# Altium project AHPR_Power_Management_and_Controls_Board.PrjPcb (part 1 of 2)
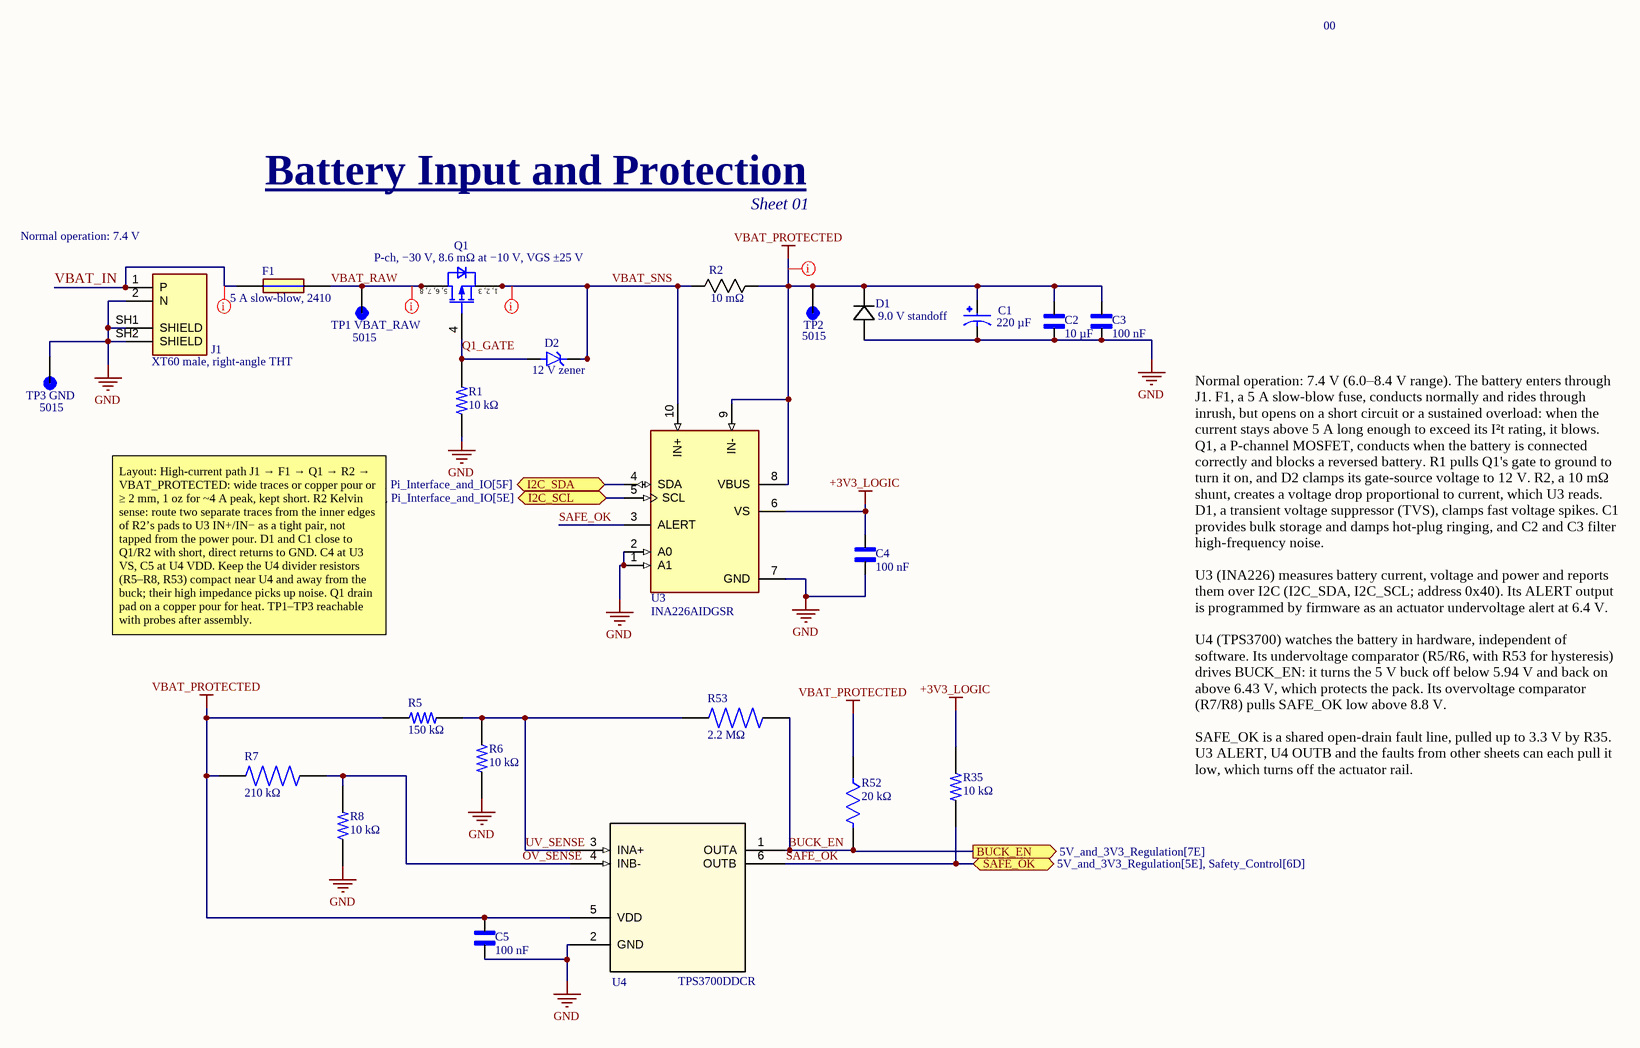
[diagram p0: Battery_Input_and_Protection.SchDoc]
5 sheets, 89 parts. Net scope: flat (ports and power ports of the same name join across sheets).
Board file: AHPR_Power_Management_and_Controls_Board.PcbDoc
Sheets:
  Battery_Input_and_Protection.SchDoc
  5V_and_3V3_Regulation.SchDoc
  Actuator_Power_and_Dynamixel_Bus.SchDoc
  Safety_Control.SchDoc
  Pi_Interface_and_IO.SchDoc

## Sheet Battery_Input_and_Protection.SchDoc
size 431 x 279 mm; SheetNumber: 1; SheetTotal: 5

### Parts
C1  220 µF  [CAP_EEEFK1E221GV]
C2  10 µF  [CAPC3216X180N]
C3  100 nF  [CAPC1608X90N]
C4  100 nF  [CAPC1608X90N]
C5  100 nF  [CAPC1608X90N]
D1  9.0 V standoff  [SMBJSeries_LTF]
D2  12 V zener  [DIO_BZT52C12-7-F]
F1  5 A slow-blow, 2410  [FUSC6127X294N]
J1  XT60 male, right-angle THT  [AMASS_XT60PW-M]
Q1  P-ch, −30 V, 8.6 mΩ at −10 V, VGS ±25 V  [INF-PG-TSDSON-8-2-V]
R1  10 kΩ  [RESC1607X60N]
R2  10 mΩ  [RES_2512_WSL]
R5  150 kΩ  [RESC1607X60N]
R6  10 kΩ  [RESC1607X60N]
R7  210 kΩ  [RESC1608X55N]
R8  10 kΩ  [RESC1607X60N]
R35  10 kΩ  [RESC1607X60N]
R52  20 kΩ  [FP-RC0603-0_55-IPC_C]
R53  2.2 MΩ  [RESC1608X55N]
TP1_VBAT_RAW  5015  [KEYSTONE_5015]
TP2  5015  [KEYSTONE_5015]
TP3_GND  5015  [KEYSTONE_5015]
U3  INA226AIDGSR  [SOP50P490X110-10N]
U4  TPS3700DDCR  [DDC6_TEX]

### Ports
BUCK_EN (out, see 5V_and_3V3_Regulation[7E]), I2C_SCL (bidir, see Pi_Interface_and_IO[5C], Pi_Interface_and_IO[5E]), I2C_SDA (bidir, see Pi_Interface_and_IO[5C], Pi_Interface_and_IO[5F]), SAFE_OK (bidir, see 5V_and_3V3_Regulation[5E], Safety_Control[6D])

### Nets
+3V3_LOGIC: C4.1 R35.1 U3.6(VS)
GND: C1.2 C2.2 C3.2 C4.2 C5.2 D1.2 J1.2(N) J1.SH1(SHIELD) J1.SH2(SHIELD) R1.1 R6.2 R8.1 TP3_GND.TP U3.1(A1) U3.2(A0) U3.7(GND) U4.2(GND)
VBAT_PROTECTED: C1.1 C2.1 C3.1 C5.1 D1.1 R2.2 R5.1 R7.2 R52.1 TP2.TP U3.8(VBUS) U3.9(IN-) U4.5(VDD)
BUCK_EN: R52.2 R53.1 U4.1(OUTA) ; port BUCK_EN
I2C_SCL: U3.5(SCL) ; port I2C_SCL
I2C_SDA: U3.4(SDA) ; port I2C_SDA
OV_SENSE: R7.1 R8.2 U4.4(INB-)
Q1_GATE: D2.2(A) Q1.4(Gate) R1.2
SAFE_OK: R35.2 U3.3(ALERT) U4.6(OUTB) ; port SAFE_OK
UV_SENSE: R5.2 R6.1 R53.2 U4.3(INA+)
VBAT_IN: F1.1 J1.1(P)
VBAT_RAW: F1.2 Q1.5(DRAIN) Q1.6(DRAIN) Q1.7(DRAIN) Q1.8(DRAIN) TP1_VBAT_RAW.TP
VBAT_SNS: D2.1(K) Q1.1(SOURCE) Q1.2(SOURCE) Q1.3(SOURCE) R2.1 U3.10(IN+)

### Layout directives
net class POWER_HI: VBAT_IN, VBAT_PROTECTED, VBAT_RAW, VBAT_SNS

### Notes on the sheet
- 00
- Battery Input and Protection
- (near J1) Normal operation: 7.4 V
- Sheet 01
- Layout: High-current path J1 → F1 → Q1 → R2 → VBAT_PROTECTED: wide traces or copper pour or ≥ 2 mm, 1 oz for ~4 A peak, kept short. R2 Kelvin sense: route two separate traces from the inner edges of R2’s pads to U3 IN+/IN− as a tight pair, not tapped from the power pour. D1 and C1 close to Q1/R2 with short, direct returns to GND. C4 at U3 VS, C5 at U4 VDD. Keep the U4 divider resistors (R5–R8, R53) compact near U4 and away from the buck; their high impedance picks up noise. Q1 drain pad on a copper pour for heat. TP1–TP3 reachable with probes after assembly.
- Normal operation: 7.4 V (6.0–8.4 V range). The battery enters through J1. F1, a 5 A slow-blow fuse, conducts normally and rides through inrush, but opens on a short circuit or a sustained overload: when the current stays above 5 A long enough to exceed its I²t rating, it blows. Q1, a P-channel MOSFET, conducts when the battery is connected correctly and blocks a reversed battery. R1 pulls Q1's gate to ground to turn it on, and D2 clamps its gate-source voltage to 12 V. R2, a 10 mΩ shunt, creates a voltage drop proportional to current, which U3 reads. D1, a transient voltage suppressor (TVS), clamps fast voltage spikes. C1 provides bulk storage and damps hot-plug ringing, and C2 and C3 filter high-frequency noise.
  U3 (INA226) measures battery current, voltage and power and reports them over I2C (I2C_SDA, I2C_SCL; address 0x40). Its ALERT output is programmed by firmware as an actuator undervoltage alert at 6.4 V.
  U4 (TPS3700) watches the battery in hardware, independent of software. Its undervoltage comparator (R5/R6, with R53 for hysteresis) drives BUCK_EN: it turns the 5 V buck off below 5.94 V and back on above 6.43 V, which protects the pack. Its overvoltage comparator (R7/R8) pulls SAFE_OK low above 8.8 V.
  SAFE_OK is a shared open-drain fault line, pulled up to 3.3 V by R35. U3 ALERT, U4 OUTB and the faults from other sheets can each pull it low, which turns off the actuator rail.
- DWG. NO.
- REV.
- SHT.
- THIS DOCUMENT AND THE DATA DISCLOSED HEREIN OR HEREWITH IS THE PROPERTY OF ALTIUM LIMITED AND MAY BE FREELY DISTRIBUTED IN WHOLE. NO RIGHTS ARE RESERVED OR EXPRESS OR IMPLIED WARANTEE GIVEN.
- REVISION
- DESCRIPTION
- DATE
- APPROVED
- ENG:
- APPROVALS
- PROJECT
- DSN:
- CHK:
- REFERENCE DOCUMENTS
- PROJECT REVISION:
- TITLE
- DOCUMENT REVISION:
- DESIGN ITEM:
- BOM:
- FAB DWG:
- PCB DWG:
- ASSY DWG:
- SCALE:
- SIZE
- B
- CAGE CODE
- FILE NAME
- DWG NO.
- SHEET
- OF
- REV
- (in symbol BSZ086P03NS3 G) 5, 6, 7, 8; 1, 2, 3

### Library data of the parts
C1 = EEEFK1E221GV: CAP ALUM 220UF 20% 25V SMD / EEEFK1E221GV / 220 µF 25 V, 160 mΩ ESR, SMD can / https://www.digikey.it/en/products/detail/panasonic-industry/EEE-FK1E221GV/10291405 / EEEFK1E221GV 220 µF 25 V, 160 mΩ ESR, SMD can; Value: *; Package: RADIAL-2 Panasonic; Purchase-URL: https://pricing.snapeda.com/search/part/EEEFK1E221GV/?ref=eda; MF: Panasonic; Check_prices: https://www.snapeda.com/parts/EEEFK1E221GV/Panasonic/view-part/?ref=eda; Price: None; MP: EEEFK1E221GV; Availability: In Stock; SnapEDA_Link: https://www.snapeda.com/parts/EEEFK1E221GV/Panasonic/view-part/?ref=snap
C2 = GRM31CR71E106KA12L: SMD capacitor X7R(EIA) with capacitance 10uF Tol.10%. Rated voltage 25Vdc 125C / 10 µF 25 V X7R 1206 / GRM31CR71E106KA12L / https://octopart.com/part/murata/GRM31CR71E106KA12L?slid=404c199c-e740-4f3a-ac3d-8ed7f0d5c56c&ssid=37a7cfac-85e6-4eb9-ad27-42d001a336a3#CadModels; MF: Murata Electronics; SnapEDA_Link: https://www.snapeda.com/parts/GRM31CR71E106KA12L/Murata+Electronics+North+America/view-part/?ref=snap; Package: 1206 Murata; Value: *; MP: GRM31CR71E106KA12L; Check_prices: https://www.snapeda.com/parts/GRM31CR71E106KA12L/Murata+Electronics+North+America/view-part/?ref=eda
C3 = GRM188R71H104KA93D: SMD Capacitor X7R(EIA) with Capacitance: 0.10uF Tol. 10%. Rated Voltage: 50Vdc / 100 nF 50 V X7R 0603 / GRM188R71H104KA93D / https://octopart.com/part/murata/GRM188R71H104KA93D?slid=b13dff97-c438-4242-af73-a6dd7cbdd469&ssid=f8334882-7657-41cd-b7d6-fdf9f837711d#CadModels; MF: Murata; SnapEDA_Link: https://www.snapeda.com/parts/GRM188R71H104KA93D/Murata/view-part/?ref=snap; Package: 1608 Murata; Value: *; MP: GRM188R71H104KA93D; Check_prices: https://www.snapeda.com/parts/GRM188R71H104KA93D/Murata/view-part/?ref=eda
C4 = GRM188R71E104KA01D: SMD Capacitor X7R(EIA) with Capacitance: 0.10uF Tol. 10%. Rated Voltage: 25Vdc / 100 nF 25 V X7R 0603 / https://octopart.com/search?full_query=GRM188R71E104KA01D&q=GRM188R71E104KA01D&s=1; MF: Murata Electronics; SnapEDA_Link: https://www.snapeda.com/parts/GRM188R71E104KA01D/Murata+Electronics+North+America/view-part/?ref=snap; Package: 1608 Murata; Value: *; MP: GRM188R71E104KA01D; Check_prices: https://www.snapeda.com/parts/GRM188R71E104KA01D/Murata+Electronics+North+America/view-part/?ref=eda
C5 = GRM188R71E104KA01D: SMD Capacitor X7R(EIA) with Capacitance: 0.10uF Tol. 10%. Rated Voltage: 25Vdc / https://octopart.com/search?full_query=GRM188R71E104KA01D&q=GRM188R71E104KA01D&s=1; MF: Murata Electronics; SnapEDA_Link: https://www.snapeda.com/parts/GRM188R71E104KA01D/Murata+Electronics+North+America/view-part/?ref=snap; Package: 1608 Murata; Value: *; MP: GRM188R71E104KA01D; Check_prices: https://www.snapeda.com/parts/GRM188R71E104KA01D/Murata+Electronics+North+America/view-part/?ref=eda
D1 = SMBJ9.0A: SMBJ9.0A / 9.0 V standoff, SMB / https://www.digikey.ie/en/products/detail/littelfuse-inc/SMBJ9-0A/688270; Manufacturer_Name: Littelfuse Inc; Copyright: Copyright (C) 2025 Ultra Librarian. All rights reserved.; Manufacturer_Part_Number: SMBJ9.0A
D2 = BZT52C12-7-F: Zener Diode 12V 5.3% 500mW SOD123 | Diodes Inc BZT52C12-7-F / BZT52C12-7-F 12 V zener, SOD-123 / https://www.digikey.com/en/products/detail/diodes-incorporated/BZT52C12-7-F/717727; MF: Diodes Inc.; SnapEDA_Link: https://www.snapeda.com/parts/BZT52C12-7-F/Diodes+Inc./view-part/?ref=snap; Package: SOD-123 Fairchild Semiconductor; Value: *; MP: BZT52C12-7-F; Check_prices: https://www.snapeda.com/parts/BZT52C12-7-F/Diodes+Inc./view-part/?ref=eda
F1 = 0454005.MR: Surface Mount Fuses 125VAC 5A .0136ohms 454 NANO2  Small size  Wide range of current rating available (0.375A to 12A)  Wide operating temperature range  RoHS compliant and Halogen Free  UL Recognized to UL/ CSA/NMX UL 248-1 and UL/CSA/NMX UL 248-14  Conforms to DENANs Appendix 3 / https://www.littelfuse.com/assetdocs/fuse-452-and-454-datasheet?assetguid=8C87AA93-80A7-4EA8-8749-A19BA03901C2; Geometry.Height: 2.94mm; Manufacturer_Name: LITTELFUSE; Manufacturer_Part_Number: 0454005.MR; Mouser Part Number: 576-0454005.MR; Mouser Price/Stock: https://www.mouser.co.uk/ProductDetail/Littelfuse/0454005MR?qs=WtG364jHAdzqVvZG3rAI%2Fw%3D%3D; Arrow Part Number: 0454005.MR; Arrow Price/Stock: https://www.arrow.com/en/products/0454005.mr/littelfuse?region=nac; Datasheet Link: https://www.mouser.com/datasheet/2/240/media-3321648.pdf
J1 = XT60PW-M: Socket, DC supply, male, PIN: 2 / https://octopart.com/part/amass/XT60PW-M; MF: AMASS; SnapEDA_Link: https://www.snapeda.com/parts/XT60PW-M/AMASS/view-part/?ref=snap; Package: Package; Value: *; MP: XT60PW-M; Check_prices: https://www.snapeda.com/parts/XT60PW-M/AMASS/view-part/?ref=eda
Q1 = BSZ086P03NS3 G: Insulated-Gate Field-Effect Transistor (IGFET), P-Channel, Enhancement, Body Diode, Pin 1 Source, 2 Source, 3 Source, 4 Gate, 5 Drain, 6 Drain, 7 Drain, 8 Drain, 8 Pins / BSZ086P03NS3 G / https://www.digikey.com/en/products/detail/infineon-technologies/BSZ086P03NS3GATMA1/2080736; Manufacturer: Infineon Technologies; Manufacturer Order Number: BSZ086P03NS3 G; PackageReference: PG-DSO-8-902
R1 R8 = RC0603FR-0710KL: 10 kOhms Â±1% 0.1W, 1/10W Chip Resistor 0603 (1608 Metric) Moisture Resistant Thick Film / 10 kΩ 1 % 0603 / https://octopart.com/part/yageo-group/RC0603FR-0710KL?slid=54dab893-c3ad-4fe4-85ee-8bc12f36e62a&ssid=b3dacb3c-e3ba-451e-bc50-2e154119b6bd#CadModels; MF: Yageo; SnapEDA_Link: https://www.snapeda.com/parts/RC0603FR-0710KL/Yageo/view-part/?ref=snap; Package: 0603 Yageo; Value: *; MP: RC0603FR-0710KL; Check_prices: https://www.snapeda.com/parts/RC0603FR-0710KL/Yageo/view-part/?ref=eda
R2 = WSL2512R0100FEA: WSL-2512 .01 1% EA e3 / WSL2512R0100FEA 10 mΩ 1 % 1 W, 2512 / https://www.digikey.com/en/products/detail/vishay-dale/WSL2512R0100FEA/712561; Manufacturer_Name: Vishay; Copyright: Copyright (C) 2026 Ultra Librarian. All rights reserved.; Manufacturer_Part_Number: WSL2512R0100FEA
R5 = RC0603FR-07150KL: 150 kOhms Â±1% 0.1W, 1/10W Chip Resistor 0603 (1608 Metric) Moisture Resistant Thick Film / 150 kΩ 1 % 0603 / Yageo RC0603FR-07150KL / https://octopart.com/part/yageo-group/RC0603FR-07150KL?slid=7267a52b-5458-460d-b3af-5cbc9f622783&ssid=8a1663fd-86ca-479a-af6d-7d8843a17d84#CadModels; SnapEDA_Link: https://www.snapeda.com/parts/RC0603FR-07150KL/Yageo/view-part/?ref=snap; Package: 0603 Yageo; Value: *; MF: Yageo; MP: RC0603FR-07150KL; Check_prices: https://www.snapeda.com/parts/RC0603FR-07150KL/Yageo/view-part/?ref=eda
R6 R35 = RC0603FR-0710KL: 10 kOhms Â±1% 0.1W, 1/10W Chip Resistor 0603 (1608 Metric) Moisture Resistant Thick Film / 10 kΩ 1 % 0603 / Yageo RC0603FR-07150KL / https://octopart.com/search?full_query=RC0603FR-0710KL&q=RC0603FR-0710KL&s=1; SnapEDA_Link: https://www.snapeda.com/parts/RC0603FR-0710KL/Yageo/view-part/?ref=snap; Package: 0603 Yageo; Value: *; MF: Yageo; MP: RC0603FR-0710KL; Check_prices: https://www.snapeda.com/parts/RC0603FR-0710KL/Yageo/view-part/?ref=eda
R7 = RC0603FR-07210KL: 210 kOhms Â±1% 0.1W, 1/10W Chip Resistor 0603 (1608 Metric) Moisture Resistant Thick Film / RC0603FR-07210KL / 210 kΩ / 10 kΩ 1 % / RC0603FR-07210KL / https://octopart.com/part/yageo-group/RC0603FR-07210KL?slid=d7ce36d7-8a58-4921-8373-64f65502f445&ssid=0484fa2a-abbb-4bdb-98e9-479695faa21c#CadModels; MF: Yageo; SnapEDA_Link: https://www.snapeda.com/parts/RC0603FR-07210KL/Yageo/view-part/?ref=snap; Package: 1608 Yageo; Value: *; MP: RC0603FR-07210KL; Check_prices: https://www.snapeda.com/parts/RC0603FR-07210KL/Yageo/view-part/?ref=eda
R52 = CMP-2000-06932-2: RES 20K OHM 1% 1/10W 0603 / 20 kOhms Â±1% 0.1W, 1/10W Chip Resistor 0603 (1608 Metric) Moisture Resistant Thick Film / SMD-RES-20K-1%-1/10W(0603) / https://octopart.com/part/yageo-group/RC0603FR-0720KL?slid=9dd42130-19c2-4799-ac31-5afd2b72cd34&ssid=b984c5c9-64c8-4793-b112-fa8b90893e5e#CadModels; Voltage Rating: 50V; Temperature Coefficient: 100ppm/°C; Power Rating: 100mW; Resistance: 20kR; Height: 0.022inch; REACH SVHC: No SVHC; Case Code (Metric): 1608; Depth: 0.8mm; Tolerance: 1%; Min Operating Temperature: -55°C; Series: RC; RoHS Compliant: Yes; Resistor Type: Thick Film; Max Power Dissipation: 100mW; Features: Moisture Resistant; Max Operating Temperature: 155°C; Package Quantity: 1; Size Code: 0603; Packaging: Tape and Reel; Width: 0.031inch; Length: 0.063inch; Military Standard: Not; Technology: THICK FILM; Number of Terminations: 2; Termination: SMD/SMT; Construction: Rectangular; Case/Package: 0603; Number of Pins: 2; Lead Free: Lead Free; Voltage Rating (DC): 50V; Resistance Tolerance: 1%; Case Code (Imperial): 0603
R53 = RC0603FR-072M2L: Äiá»‡n trá»Ÿ mÃ ng dÃ y gáº¯n bá» máº·t, DÃ²ng RC, 2,2 Mohm, 100 mW, - 1%, 50 V, 0603 [1608 Metric] / RC0603FR-072M2L / https://octopart.com/part/yageo-group/RC0603FR-072M2L?slid=d71ab9d8-a679-4832-96ed-b1c44a9cfdb9&ssid=0251966b-910a-4a6a-9854-0248babda200#CadModels; MF: Yageo; SnapEDA_Link: https://www.snapeda.com/parts/RC0603FR-072M2L/Yageo/view-part/?ref=snap; Package: 1608 Yageo; Value: *; MP: RC0603FR-072M2L; Check_prices: https://www.snapeda.com/parts/RC0603FR-072M2L/Yageo/view-part/?ref=eda
TP1_VBAT_RAW TP2 TP3_GND = 5015: Test Point Micro Mini SMT Phos Bronze/Silver 1000pc Tape & Reel | Keystone Electronics 5015 / https://www.digikey.ca/en/products/detail/keystone-electronics/5015/278886; SnapEDA_Link: https://www.snapeda.com/parts/5015/Keystone/view-part/?ref=snap; Package: None; Value: *; MF: Keystone Electronics; MP: 5015; Check_prices: https://www.snapeda.com/parts/5015/Keystone/view-part/?ref=eda
U3 = INA226AIDGSR: 36V, 16-bit, ultra-precise i2c output current/voltage/power monitor w/alert; MF: Texas Instruments; SnapEDA_Link: https://www.snapeda.com/parts/INA226AIDGSR/Texas+Instruments/view-part/?ref=snap; Package: VSSOP-10 Texas Instruments; Value: *; MP: INA226AIDGSR; Check_prices: https://www.snapeda.com/parts/INA226AIDGSR/Texas+Instruments/view-part/?ref=eda
U4 = TPS3700DDCR: High-voltage (18-V) window voltage detector for overvoltage and undervoltage monitoring 6-SOT-23-THIN -40 to 125; Manufacturer_Name: Texas Instruments; Copyright: Copyright (C) 2026 Ultra Librarian. All rights reserved.; Manufacturer_Part_Number: TPS3700DDCR; RefDes: RefDes; Type: Type

## Sheet 5V_and_3V3_Regulation.SchDoc
size 431 x 279 mm; SheetNumber: 2; SheetTotal: 5
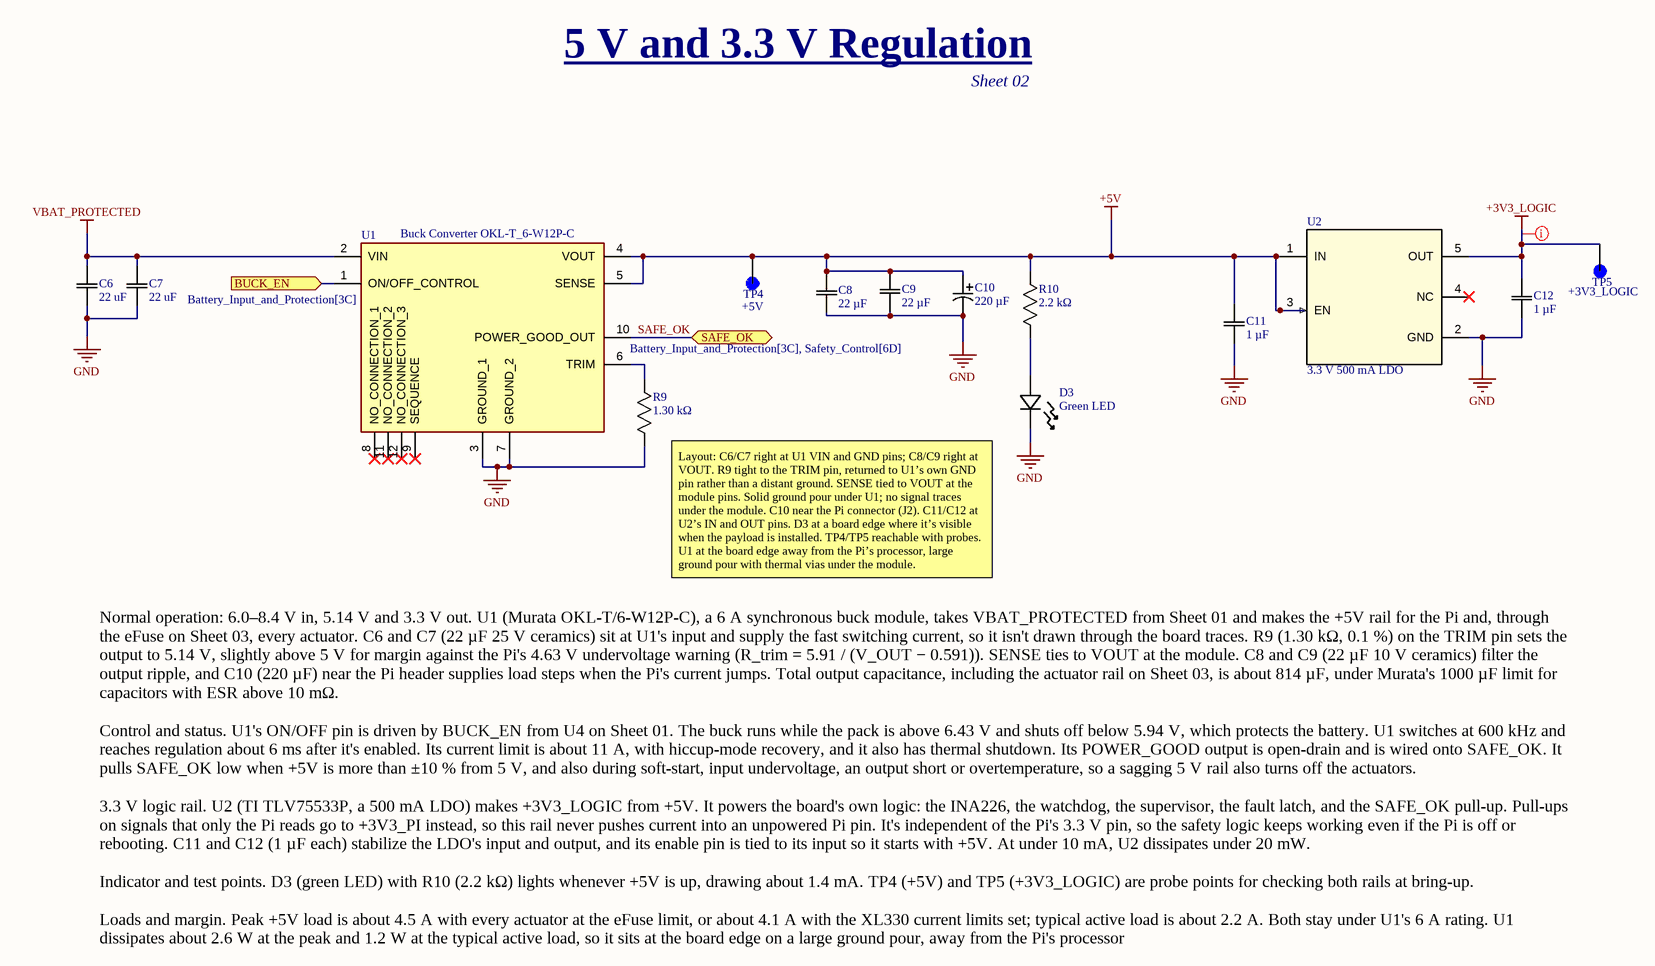
[diagram p1: 5V_and_3V3_Regulation.SchDoc]

### Parts
C6  22 uF  [G-32_MUR]
C7  22 uF  [G-32_MUR]
C8  22 µF  [CAP_GRM32ED_MUR]
C9  22 µF  [CAP_GRM32ED_MUR]
C10  220 µF  [CAP_EEFK_D_PAN]
C11  1 µF  [G-188_MUR]
C12  1 µF  [G-188_MUR]
D3  Green LED  [LED_LTST-C191KGKT_LTO]
R9  1.30 kΩ  [RC0603N_YAG]
R10  2.2 kΩ  [RC0603N_YAG]
TP4  +5V  [KEYSTONE_5015]
TP5  +3V3_LOGIC  [KEYSTONE_5015]
U1  Buck Converter OKL-T_6-W12P-C  [OKLT6W12PC]
U2  3.3 V 500 mA LDO  [DBV0005A_N]

### Ports
BUCK_EN (in, see Battery_Input_and_Protection[3C]), SAFE_OK (bidir, see Battery_Input_and_Protection[3C], Safety_Control[6D])

### Nets
+3V3_LOGIC: C12.1 TP5.TP U2.5(OUT)
+5V: C8.2 C9.2 C10.1 C11.1 R10.2 TP4.TP U1.4(VOUT) U1.5(SENSE) U2.1(IN) U2.3(EN)
GND: C6.2 C7.2 C8.1 C9.1 C10.2 C11.2 C12.2 D3.1(CATHODE) R9.2 U1.3(GROUND_1) U1.7(GROUND_2) U2.2(GND)
VBAT_PROTECTED: C6.1 C7.1 U1.2(VIN)
BUCK_EN: U1.1(ON/OFF_CONTROL) ; port BUCK_EN
SAFE_OK: U1.10(POWER_GOOD_OUT) ; port SAFE_OK
NetD3_2: D3.2(ANODE) R10.1
NetR9_1: R9.1 U1.6(TRIM)

Not connected (* = marked no-connect by the designer): U1 8(NO_CONNECTION_1)* 9(SEQUENCE)* 11(NO_CONNECTION_2)* 12(NO_CONNECTION_3)*; U2 4(NC)*

### Layout directives
net class POWER_LO: +3V3_LOGIC

### Notes on the sheet
- 5 V and 3.3 V Regulation
- Sheet 02
- Layout: C6/C7 right at U1 VIN and GND pins; C8/C9 right at VOUT. R9 tight to the TRIM pin, returned to U1’s own GND pin rather than a distant ground. SENSE tied to VOUT at the module pins. Solid ground pour under U1; no signal traces under the module. C10 near the Pi connector (J2). C11/C12 at U2’s IN and OUT pins. D3 at a board edge where it’s visible when the payload is installed. TP4/TP5 reachable with probes. U1 at the board edge away from the Pi’s processor, large ground pour with thermal vias under the module.
- Normal operation: 6.0–8.4 V in, 5.14 V and 3.3 V out. U1 (Murata OKL-T/6-W12P-C), a 6 A synchronous buck module, takes VBAT_PROTECTED from Sheet 01 and makes the +5V rail for the Pi and, through the eFuse on Sheet 03, every actuator. C6 and C7 (22 µF 25 V ceramics) sit at U1's input and supply the fast switching current, so it isn't drawn through the board traces. R9 (1.30 kΩ, 0.1 %) on the TRIM pin sets the output to 5.14 V, slightly above 5 V for margin against the Pi's 4.63 V undervoltage warning (R_trim = 5.91 / (V_OUT − 0.591)). SENSE ties to VOUT at the module. C8 and C9 (22 µF 10 V ceramics) filter the output ripple, and C10 (220 µF) near the Pi header supplies load steps when the Pi's current jumps. Total output capacitance, including the actuator rail on Sheet 03, is about 814 µF, under Murata's 1000 µF limit for capacitors with ESR above 10 mΩ.
  Control and status. U1's ON/OFF pin is driven by BUCK_EN from U4 on Sheet 01. The buck runs while the pack is above 6.43 V and shuts off below 5.94 V, which protects the battery. U1 switches at 600 kHz and reaches regulation about 6 ms after it's enabled. Its current limit is about 11 A, with hiccup-mode recovery, and it also has thermal shutdown. Its POWER_GOOD output is open-drain and is wired onto SAFE_OK. It pulls SAFE_OK low when +5V is more than ±10 % from 5 V, and also during soft-start, input undervoltage, an output short or overtemperature, so a sagging 5 V rail also turns off the actuators.
  3.3 V logic rail. U2 (TI TLV75533P, a 500 mA LDO) makes +3V3_LOGIC from +5V. It powers the board's own logic: the INA226, the watchdog, the supervisor, the fault latch, and the SAFE_OK pull-up. Pull-ups on signals that only the Pi reads go to +3V3_PI instead, so this rail never pushes current into an unpowered Pi pin. It's independent of the Pi's 3.3 V pin, so the safety logic keeps working even if the Pi is off or rebooting. C11 and C12 (1 µF each) stabilize the LDO's input and output, and its enable pin is tied to its input so it starts with +5V. At under 10 mA, U2 dissipates under 20 mW.
  Indicator and test points. D3 (green LED) with R10 (2.2 kΩ) lights whenever +5V is up, drawing about 1.4 mA. TP4 (+5V) and TP5 (+3V3_LOGIC) are probe points for checking both rails at bring-up.
  Loads and margin. Peak +5V load is about 4.5 A with every actuator at the eFuse limit, or about 4.1 A with the XL330 current limits set; typical active load is about 2.2 A. Both stay under U1's 6 A rating. U1 dissipates about 2.6 W at the peak and 1.2 W at the typical active load, so it sits at the board edge on a large ground pour, away from the Pi's processor
- DWG. NO.
- REV.
- SHT.
- THIS DOCUMENT AND THE DATA DISCLOSED HEREIN OR HEREWITH IS THE PROPERTY OF ALTIUM LIMITED AND MAY BE FREELY DISTRIBUTED IN WHOLE. NO RIGHTS ARE RESERVED OR EXPRESS OR IMPLIED WARANTEE GIVEN.
- REVISION
- DESCRIPTION
- DATE
- APPROVED
- ENG:
- APPROVALS
- PROJECT
- DSN:
- CHK:
- REFERENCE DOCUMENTS
- PROJECT REVISION:
- TITLE
- DOCUMENT REVISION:
- DESIGN ITEM:
- BOM:
- FAB DWG:
- PCB DWG:
- ASSY DWG:
- SCALE:
- SIZE
- B
- CAGE CODE
- FILE NAME
- DWG NO.
- SHEET
- OF
- REV

### Library data of the parts
C6 C7 = GRM32ER71E226KE15L: CAP, CERM, 22 uF, 25 V, +/- 10%, X7R, 1210 / Murata GRM32ER71E226KE15L / https://www.digikey.com/en/products/detail/murata-electronics/GRM32ER71E226KE15L/2039040; Copyright: Copyright (C) 2025 Ultra Librarian. All rights reserved.; Manufacturer_Name: Murata; Manufacturer_Part_Number: GRM32ER71E226KE15L
C8 C9 = GRM32ER71A226KE20L: Murata GRM32ER71A226KE20L / 22 µF 10 V X7R / https://www.digikey.com/en/products/detail/murata-electronics/GRM32ER71A226KE20L/586573; Copyright: Copyright (C) 2025 Ultra Librarian. All rights reserved.; Manufacturer_Name: Murata; Manufacturer_Part_Number: GRM32ER71A226KE20L
C10 = EEE-FK0J221P: Panasonic EEE-FK0J221P / 220 µF 6.3 V aluminum (total output C ≈ 734 µF, under the 1000 µF limit) / https://www.digikey.com/en/products/detail/panasonic-industry/EEE-FK0J221P/765937; Copyright: Copyright (C) 2026 Ultra Librarian. All rights reserved.; Manufacturer_Name: Panasonic; Manufacturer_Part_Number: EEE-FK0J221P
C11 C12 = GRM188R71A105KA61D: Murata GRM188R71A105KA61D / 1 µF 10 V X7R / https://www.digikey.com/en/products/detail/murata-electronics/GRM188R71A105KA61D/965913; Copyright: Copyright (C) 2025 Ultra Librarian. All rights reserved.; Manufacturer_Name: Murata; Manufacturer_Part_Number: GRM188R71A105KA61D
D3 = LTST-C191KGKT: Lite-On LTST-C191KGKT / Green LED / 0603 / https://www.digikey.com/en/products/detail/liteon/LTST-C191KGKT/386835; Type: LED Indication; Copyright: Copyright (C) 2025 Ultra Librarian. All rights reserved.; Manufacturer_Name: LITE-ON; Manufacturer_Part_Number: LTST-C191KGKT
R9 = RT0603BRD071K3L: Yageo RT0603BRD071K3L / 1.30 kΩ 0.1 % thin film (Murata asks ≤ 0.5 %, ≤ 100 ppm/°C) / 0603 / Output trim, 5.14 V / https://www.digikey.com/en/products/result?keywords=RT0603BRD071K3L; Copyright: Copyright (C) 2026 Ultra Librarian. All rights reserved.; Manufacturer_Name: Yageo; Manufacturer_Part_Number: RT0603BRD071K3L
R10 = RC0603FR-072K2L: RC0603FR-072K2L / 2.2 kΩ 1 % (~7 mW in D3) / 0603 / https://www.digikey.com/en/products/detail/yageo/RC0603FR-072K2L/727016; Manufacturer_Name: Yageo; Copyright: Copyright (C) 2025 Ultra Librarian. All rights reserved.; Manufacturer_Part_Number: RC0603FR-072K2L
TP4 TP5 = 5015: Test Point Micro Mini SMT Phos Bronze/Silver 1000pc Tape & Reel | Keystone Electronics 5015; SnapEDA_Link: https://www.snapeda.com/parts/5015/Keystone/view-part/?ref=snap; Package: None; Value: *; MF: Keystone Electronics; MP: 5015; Check_prices: https://www.snapeda.com/parts/5015/Keystone/view-part/?ref=eda
U1 = OKL-T_6-W12P-C: MURATA POWER SOLUTIONS - OKL-T/6-W12P-C - DC-DC CONVERTER, 0.591V TO 5.5V, MODULE; Manufacturer_Name: Murata Electronics; Geometry.Height: 7.2mm; Manufacturer_Part_Number: OKL-T/6-W12P-C; Mouser Part Number: 580-OKL-T/6-W12P-C; Mouser Price/Stock: https://www.mouser.co.uk/ProductDetail/Murata-Power-Solutions/OKL-T-6-W12P-C?qs=CxV9Ey7RZVdXGDAP%2FweYNg%3D%3D; Arrow Part Number: OKL-T/6-W12P-C; Arrow Price/Stock: https://www.arrow.com/en/products/okl-t6-w12p-c/murata-power-solutions?region=nac; Datasheet Link: https://www.murata.com/products/productdata/8807038255134/okl-t6-w12.pdf?1583754815000
U2 = TLV75533PDBVR: 500mA high-PSRR low-I<sub>Q</sub> low-dropout voltage regulator with enable 5-SOT-23 -40 to 125 / TI TLV75533PDBVR / 3.3 V 500 mA LDO / https://www.digikey.com/en/products/detail/texas-instruments/TLV75533PDBVR/9356541; Manufacturer_Name: Texas Instruments; TYPE: TYPE; RefDes: RefDes; Copyright: Copyright (C) 2026 Ultra Librarian. All rights reserved.; Manufacturer_Part_Number: TLV75533PDBVR

## Sheet Actuator_Power_and_Dynamixel_Bus.SchDoc
size 431 x 279 mm; SheetNumber: 3; SheetTotal: 5
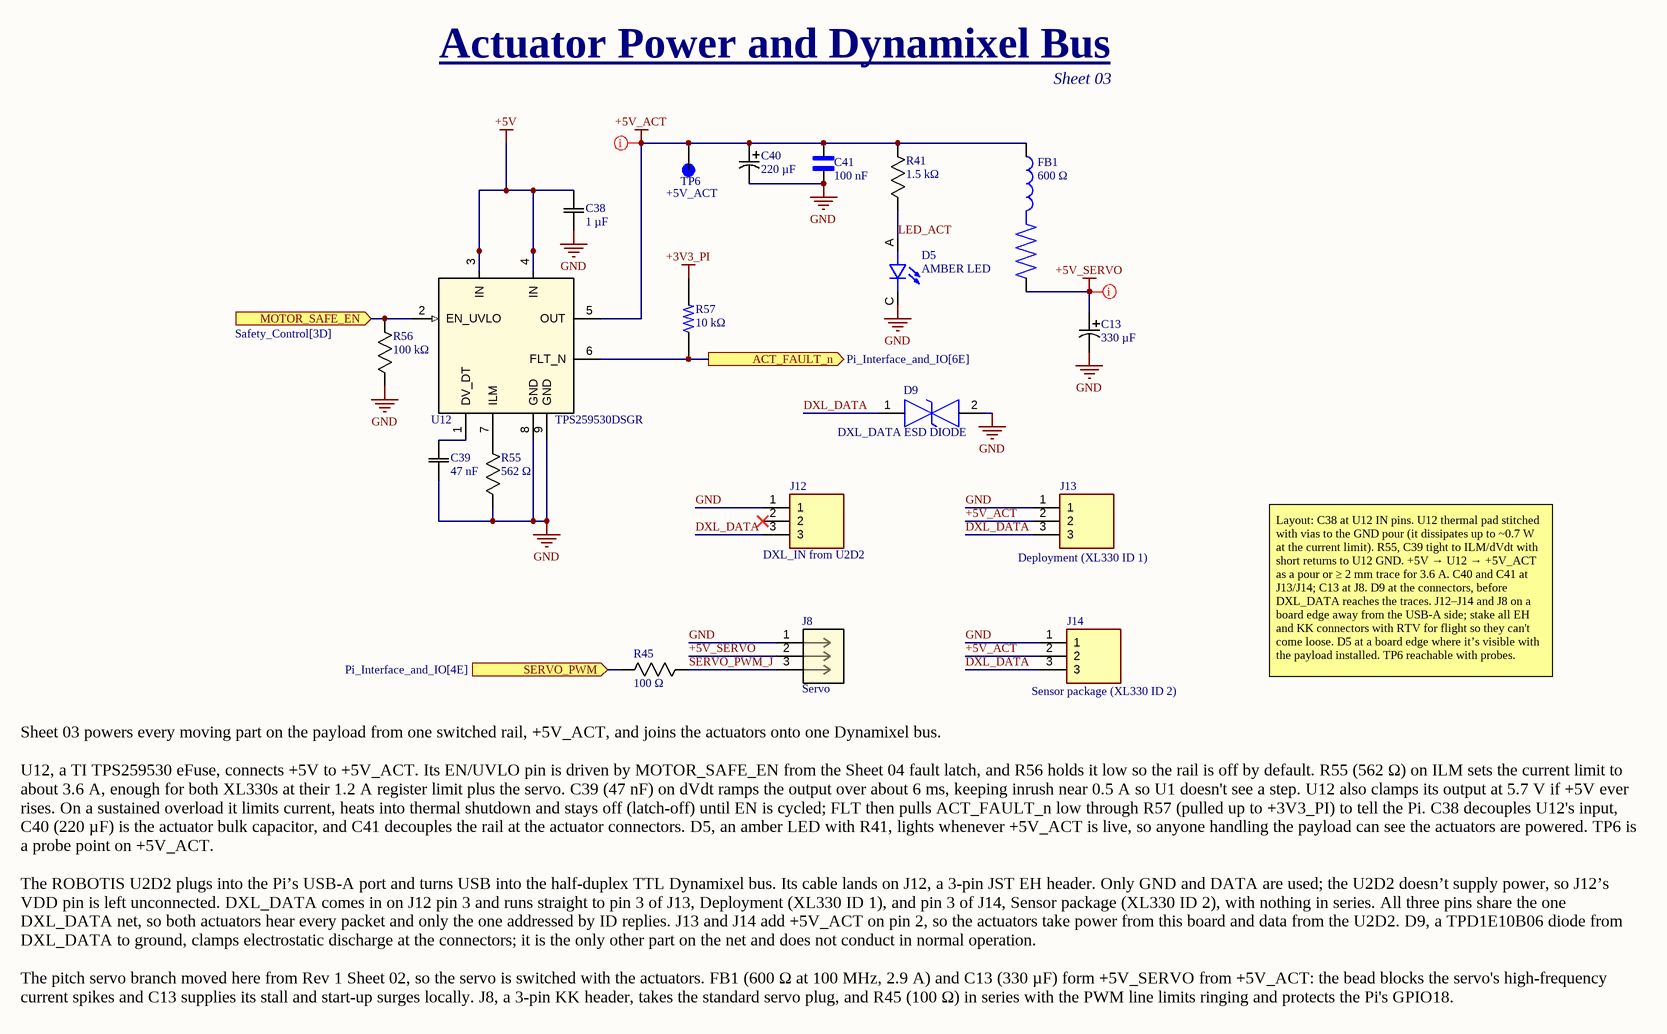
[diagram p2: Actuator_Power_and_Dynamixel_Bus.SchDoc]

### Parts
C13  330 µF  [CAP_EEFK_E_PAN]
C38  1 µF  [G-188_MUR]
C39  47 nF  [YAG_CC0603_YAG]
C40  220 µF  [CAP_EEFK_D_PAN]
C41  100 nF  [CAPC1608X90N]
D5  AMBER LED  [LEDC1608X55N]
D9  DXL_DATA ESD DIODE  [SODFL1608X77N]
FB1  600 Ω  [BEADC3216X180N]
J8  Servo  [CONN_A-6373-03A_MOL]
J12  DXL_IN from U2D2  [B3BEHALFSN]
J13  Deployment (XL330 ID 1)  [B3BEHALFSN]
J14  Sensor package (XL330 ID 2)  [B3BEHALFSN]
R41  1.5 kΩ  [RC0603N_YAG]
R45  100 Ω  [RC0603N_YAG]
R55  562 Ω  [RC0603N_YAG]
R56  100 kΩ  [RC0603N_YAG]
R57  10 kΩ  [RESC1607X60N]
TP6  +5V_ACT  [KEYSTONE_5015]
U12  TPS259530DSGR  [DSG0008A]

### Ports
ACT_FAULT_n (out, see Pi_Interface_and_IO[6E]), MOTOR_SAFE_EN (in, see Safety_Control[3D]), SERVO_PWM (in, see Pi_Interface_and_IO[4E])

### Nets
+3V3_PI: R57.2
+5V: C38.2 U12.3(IN) U12.4(IN)
+5V_ACT: C40.1 C41.2 FB1.1 J13.2 J14.2 R41.1 TP6.TP U12.5(OUT)
+5V_SERVO: C13.1 FB1.2 J8.2
GND: C13.2 C38.1 C39.2 C40.2 C41.1 D5.C D9.2 J8.1 J12.1 J13.1 J14.1 R55.2 R56.1 U12.8(GND) U12.9(GND)
ACT_FAULT_n: R57.1 U12.6(FLT_N) ; port ACT_FAULT_n
DXL_DATA: D9.1 J12.3 J13.3 J14.3
LED_ACT: D5.A R41.2
MOTOR_SAFE_EN: R56.2 U12.2(EN_UVLO) ; port MOTOR_SAFE_EN
SERVO_PWM: R45.2 ; port SERVO_PWM
SERVO_PWM_J: J8.3 R45.1
NetC39_1: C39.1 U12.1(DV_DT)
NetR55_1: R55.1 U12.7(ILM)

Not connected (* = marked no-connect by the designer): J12 2*

### Layout directives
net class POWER_HI: +5V_ACT, +5V_SERVO

### Notes on the sheet
- Actuator Power and Dynamixel Bus
- Sheet 03
- Layout: C38 at U12 IN pins. U12 thermal pad stitched with vias to the GND pour (it dissipates up to ~0.7 W at the current limit). R55, C39 tight to ILM/dVdt with short returns to U12 GND. +5V → U12 → +5V_ACT as a pour or ≥ 2 mm trace for 3.6 A. C40 and C41 at J13/J14; C13 at J8. D9 at the connectors, before DXL_DATA reaches the traces. J12–J14 and J8 on a board edge away from the USB-A side; stake all EH and KK connectors with RTV for flight so they can't come loose. D5 at a board edge where it’s visible with the payload installed. TP6 reachable with probes.
- Sheet 03 powers every moving part on the payload from one switched rail, +5V_ACT, and joins the actuators onto one Dynamixel bus.
  U12, a TI TPS259530 eFuse, connects +5V to +5V_ACT. Its EN/UVLO pin is driven by MOTOR_SAFE_EN from the Sheet 04 fault latch, and R56 holds it low so the rail is off by default. R55 (562 Ω) on ILM sets the current limit to about 3.6 A, enough for both XL330s at their 1.2 A register limit plus the servo. C39 (47 nF) on dVdt ramps the output over about 6 ms, keeping inrush near 0.5 A so U1 doesn't see a step. U12 also clamps its output at 5.7 V if +5V ever rises. On a sustained overload it limits current, heats into thermal shutdown and stays off (latch-off) until EN is cycled; FLT then pulls ACT_FAULT_n low through R57 (pulled up to +3V3_PI) to tell the Pi. C38 decouples U12's input, C40 (220 µF) is the actuator bulk capacitor, and C41 decouples the rail at the actuator connectors. D5, an amber LED with R41, lights whenever +5V_ACT is live, so anyone handling the payload can see the actuators are powered. TP6 is a probe point on +5V_ACT.
  The ROBOTIS U2D2 plugs into the Pi’s USB-A port and turns USB into the half-duplex TTL Dynamixel bus. Its cable lands on J12, a 3-pin JST EH header. Only GND and DATA are used; the U2D2 doesn’t supply power, so J12’s VDD pin is left unconnected. DXL_DATA comes in on J12 pin 3 and runs straight to pin 3 of J13, Deployment (XL330 ID 1), and pin 3 of J14, Sensor package (XL330 ID 2), with nothing in series. All three pins share the one DXL_DATA net, so both actuators hear every packet and only the one addressed by ID replies. J13 and J14 add +5V_ACT on pin 2, so the actuators take power from this board and data from the U2D2. D9, a TPD1E10B06 diode from DXL_DATA to ground, clamps electrostatic discharge at the connectors; it is the only other part on the net and does not conduct in normal operation.
  The pitch servo branch moved here from Rev 1 Sheet 02, so the servo is switched with the actuators. FB1 (600 Ω at 100 MHz, 2.9 A) and C13 (330 µF) form +5V_SERVO from +5V_ACT: the bead blocks the servo's high-frequency current spikes and C13 supplies its stall and start-up surges locally. J8, a 3-pin KK header, takes the standard servo plug, and R45 (100 Ω) in series with the PWM line limits ringing and protects the Pi's GPIO18.
- DWG. NO.
- REV.
- SHT.
- THIS DOCUMENT AND THE DATA DISCLOSED HEREIN OR HEREWITH IS THE PROPERTY OF ALTIUM LIMITED AND MAY BE FREELY DISTRIBUTED IN WHOLE. NO RIGHTS ARE RESERVED OR EXPRESS OR IMPLIED WARANTEE GIVEN.
- REVISION
- DESCRIPTION
- DATE
- APPROVED
- ENG:
- APPROVALS
- PROJECT
- DSN:
- CHK:
- REFERENCE DOCUMENTS
- PROJECT REVISION:
- TITLE
- DOCUMENT REVISION:
- DESIGN ITEM:
- BOM:
- FAB DWG:
- PCB DWG:
- ASSY DWG:
- SCALE:
- SIZE
- B
- CAGE CODE
- FILE NAME
- DWG NO.
- SHEET
- OF
- REV

### Library data of the parts
C13 = EEE-FK0J331P: Panasonic EEE-FK0J331P / 330 µF 6.3 V aluminum (was 470 µF; reduced to keep U1 under 1000 µF) / SMD can / Servo bulk at J8 / https://www.digikey.com/en/products/result?keywords=EEE-FK0J331P; Copyright: Copyright (C) 2026 Ultra Librarian. All rights reserved.; Manufacturer_Name: Panasonic; Manufacturer_Part_Number: EEE-FK0J331P
C38 = GRM188R71A105KA61D: Murata GRM188R71A105KA61D / 1 µF 10 V X7R / 0603 / U12 input decoupling / https://octopart.com/search?q=GRM188R71A105KA61D; Copyright: Copyright (C) 2025 Ultra Librarian. All rights reserved.; Manufacturer_Name: Murata; Manufacturer_Part_Number: GRM188R71A105KA61D
C39 = CC0603KRX7R9BB473: Yageo CC0603KRX7R9BB473 / 47 nF 50 V X7R / 0603 / dVdt: about 0.9 V/ms, 6 ms ramp / https://www.digikey.com/en/products/result?keywords=CC0603KRX7R9BB473; Copyright: Copyright (C) 2026 Ultra Librarian. All rights reserved.; Manufacturer_Name: Yageo; Manufacturer_Part_Number: CC0603KRX7R9BB473
C40 = EEE-FK0J221P: Panasonic EEE-FK0J221P / 220 µF 6.3 V aluminum / SMD can / +5V_ACT bulk at J13/J14 / https://octopart.com/part/panasonic/EEE-FK0J221P; Copyright: Copyright (C) 2026 Ultra Librarian. All rights reserved.; Manufacturer_Name: Panasonic; Manufacturer_Part_Number: EEE-FK0J221P
C41 = GRM188R71H104KA93D: SMD Capacitor X7R(EIA) with Capacitance: 0.10uF Tol. 10%. Rated Voltage: 50Vdc / Murata GRM188R71H104KA93D / 100 nF 50 V X7R / 0603 / +5V_ACT decoupling at the connectors / https://www.digikey.com/en/products/result?keywords=GRM188R71H104KA93D; SnapEDA_Link: https://www.snapeda.com/parts/GRM188R71H104KA93D/Murata/view-part/?ref=snap; Package: 1608 Murata; Value: *; MF: Murata; MP: GRM188R71H104KA93D; Check_prices: https://www.snapeda.com/parts/GRM188R71H104KA93D/Murata/view-part/?ref=eda
D5 = LTST-C191KFKT: Orange 605nm LED Indication - Discrete 2V 0603 (1608 Metric) / LTST-C191KFKT / Lite-On LTST-C191KFKT / Orange/amber 605 nm / 0603 / Actuator-rail-live indicator / https://www.digikey.com/en/products/detail/lite-on-inc/LTST-C191KFKT/386833; MF: Lite-On Inc.; Check_prices: https://www.snapeda.com/parts/LTST-C191KFKT/Lite-On+Inc./view-part/?ref=eda; Availability: In Stock; Price: None; Package: 0603 Lite-On; MP: LTST-C191KFKT; Value: *; SnapEDA_Link: https://www.snapeda.com/parts/LTST-C191KFKT/Lite-On+Inc./view-part/?ref=snap; Purchase-URL: https://pricing.snapeda.com/search/part/LTST-C191KFKT/?ref=eda
D9 = TPD1E10B06DYAR: ESD Suppressors / TVS Diodes 12-pF, +/-5.5V, +/-30-kV ESD protection diode in 0402 and SOD-523 package TPD1E10B06DYAR / TI TPD1E10B06DYAR / Bidirectional ESD diode, 6 V working / SOD-523 (DYA) / DXL_DATA ESD / https://www.digikey.com/en/products/detail/texas-instruments/TPD1E10B06DYAR/15853876; Manufacturer_Name: Texas Instruments; Geometry.Height: 0.77mm; Manufacturer_Part_Number: TPD1E10B06DYAR; Mouser Part Number: 595-TPD1E10B06DYAR; Mouser Price/Stock: https://www.mouser.co.uk/ProductDetail/Texas-Instruments/TPD1E10B06DYAR?qs=Rp5uXu7WBW9%2F66n97S3Kgw%3D%3D; Arrow Part Number: TPD1E10B06DYAR; Arrow Price/Stock: https://www.arrow.com/en/products/tpd1e10b06dyar/texas-instruments.html?utm_currency=USD&region=nac; Datasheet Link: https://www.ti.com/lit/ds/symlink/tpd1e10b06.pdf?ts=1676259025619&ref_url=https%253A%252F%252Fwww.ti.com%252Fproduct%252FTPD1E10B06%252Fpart-details%252FTPD1E10B06DYAR
FB1 = BLM31KN601SN1L: 600 Ohms @ 100MHz 1 Power Line Ferrite Bead 1206 _3216 Metric_ 2.9A 38mOhm / Murata BLM31KN601SN1L / 600 Ω at 100 MHz, 2.9 A, 38 mΩ / https://www.digikey.com/en/products/detail/murata-electronics/BLM31KN601SN1L/7564098; MP: BLM31KN601SN1L; Availability: Unavailable; SnapEDA_Link: https://www.snapeda.com/parts/BLM31KN601SN1L/Murata/view-part/4302166/?ref=snap; Package: 3216 Murata; MF: Murata; Price: None; Value: *
J8 = 22232031: KK 254 Solid Header, Vertical, with Friction Lock, 3 Circuits, Tin (Sn) Plating, Bag / Molex 22-23-2031 / 3-pin 2.54 mm KK, friction lock / THT, vertical / Servo (standard servo plug fits) / https://www.digikey.com/en/products/result?keywords=22-23-2031; Manufacturer_Name: Molex Connector Corporation; Copyright: Copyright (C) 2025 Ultra Librarian. All rights reserved.; Manufacturer_Part_Number: 22232031; RefDes: RefDes; Type: Type
J12 = B3B-EH-A__LF___SN_: 3 way 1 row top entry header,2.5mm pitch JST EH Series, 2.5mm Pitch 3 Way 1 Row Straight PCB Header, Solder Termination, 3A / JST B3B-EH-A(LF)(SN) / 3-pin EH, 2.5 mm, 3 A / THT, vertical / DXL_IN from the U2D2 (pin 2 VDD not connected) / https://www.digikey.com/en/products/result?keywords=B3B-EH-A / https://octopart.com/part/jst/B3B-EH-A%28LF%29%28SN%29?slid=a2ca3f22-0411-4852-8878-7eb0f241f67c&ssid=41117a84-245e-4aff-a845-413bdd9f3cb2#CadModels; Manufacturer_Name: JST (JAPAN SOLDERLESS TERMINALS); Geometry.Height: 6mm; Manufacturer_Part_Number: B3B-EH-A (LF) (SN); Mouser Part Number: *; Mouser Price/Stock: *; Arrow Part Number: *; Arrow Price/Stock: *; Datasheet Link: http://www.jst-mfg.com/product/pdf/eng/eEH.pdf
J13 = B3B-EH-A__LF___SN_: 3 way 1 row top entry header,2.5mm pitch JST EH Series, 2.5mm Pitch 3 Way 1 Row Straight PCB Header, Solder Termination, 3A / JST B3B-EH-A(LF)(SN) / 3-pin EH, 2.5 mm, 3 A / THT, vertical / ) / https://www.digikey.com/en/products/result?keywords=B3B-EH-A / https://octopart.com/part/jst/B3B-EH-A%28LF%29%28SN%29?slid=a2ca3f22-0411-4852-8878-7eb0f241f67c&ssid=41117a84-245e-4aff-a845-413bdd9f3cb2#CadModels; Manufacturer_Name: JST (JAPAN SOLDERLESS TERMINALS); Geometry.Height: 6mm; Manufacturer_Part_Number: B3B-EH-A (LF) (SN); Mouser Part Number: *; Mouser Price/Stock: *; Arrow Part Number: *; Arrow Price/Stock: *; Datasheet Link: http://www.jst-mfg.com/product/pdf/eng/eEH.pdf
J14 = B3B-EH-A__LF___SN_: 3 way 1 row top entry header,2.5mm pitch JST EH Series, 2.5mm Pitch 3 Way 1 Row Straight PCB Header, Solder Termination, 3A / JST B3B-EH-A(LF)(SN) / 3-pin EH, 2.5 mm, 3 A / THT, vertical / https://www.digikey.com/en/products/result?keywords=B3B-EH-A / https://octopart.com/part/jst/B3B-EH-A%28LF%29%28SN%29?slid=a2ca3f22-0411-4852-8878-7eb0f241f67c&ssid=41117a84-245e-4aff-a845-413bdd9f3cb2#CadModels; Manufacturer_Name: JST (JAPAN SOLDERLESS TERMINALS); Geometry.Height: 6mm; Manufacturer_Part_Number: B3B-EH-A (LF) (SN); Mouser Part Number: *; Mouser Price/Stock: *; Arrow Part Number: *; Arrow Price/Stock: *; Datasheet Link: http://www.jst-mfg.com/product/pdf/eng/eEH.pdf
R41 = RC0603FR-0715KL: RES SMD 15K OHM 1% 1/10W 0603 / Yageo RC0603FR-071K5L / 1.5 kΩ 1 % / 0603 / D5 current: (5.14 − 2.0) / 1.5 kΩ ≈ 2.1 mA / https://www.digikey.com/en/products/result?keywords=RC0603FR-071K5L; Copyright: Copyright (C) 2026 Ultra Librarian. All rights reserved.; Manufacturer_Name: Yageo; Manufacturer_Part_Number: RC0603FR-0715KL
R45 = RC0603FR-07100RL: Yageo RC0603FR-07100RL / 100 Ω 1 % / 0603 / Servo PWM series / https://www.digikey.com/en/products/result?keywords=RC0603FR-07100RL; Copyright: Copyright (C) 2026 Ultra Librarian. All rights reserved.; Manufacturer_Name: Yageo; Manufacturer_Part_Number: RC0603FR-07100RL
R55 = RC0603FR-07562RL: Yageo RC0603FR-07562RL / 562 Ω 1 % / 0603 / ILM: I_LIM = 2000 / 562 + 0.04 ≈ 3.6 A (verify equation) / https://www.digikey.com/en/products/result?keywords=RC0603FR-07562RL; Copyright: Copyright (C) 2026 Ultra Librarian. All rights reserved.; Manufacturer_Name: Yageo; Manufacturer_Part_Number: RC0603FR-07562RL
R56 = RC0603FR-07100KL: RES, 100 k, 1%, 0.1 W, 0603 / Yageo RC0603FR-07100KL / 100 kΩ 1 % / 0603 / U12 EN pulldown: actuators off by default / https://www.digikey.com/en/products/result?keywords=RC0603FR-07100KL; Copyright: Copyright (C) 2025 Ultra Librarian. All rights reserved.; Manufacturer_Name: Yageo; Manufacturer_Part_Number: RC0603FR-07100KL
R57 = RC0603FR-0710KL: 10 kOhms Â±1% 0.1W, 1/10W Chip Resistor 0603 (1608 Metric) Moisture Resistant Thick Film / Yageo RC0603FR-0710KL / 10 kΩ 1 % / 0603 / FLT pull-up to +3V3_PI (ACT_FAULT_n) / https://www.digikey.com/en/products/result?keywords=RC0603FR-0710KL; SnapEDA_Link: https://www.snapeda.com/parts/RC0603FR-0710KL/Yageo/view-part/?ref=snap; Package: 0603 Yageo; Value: *; MF: Yageo; MP: RC0603FR-0710KL; Check_prices: https://www.snapeda.com/parts/RC0603FR-0710KL/Yageo/view-part/?ref=eda
TP6 = 5015: Test Point Micro Mini SMT Phos Bronze/Silver 1000pc Tape & Reel | Keystone Electronics 5015 / Keystone 5015 / SMT test point / SMD / +5V_ACT / https://www.digikey.ca/en/products/detail/keystone-electronics/5015/278886; SnapEDA_Link: https://www.snapeda.com/parts/5015/Keystone/view-part/?ref=snap; Package: None; Value: *; MF: Keystone Electronics; MP: 5015; Check_prices: https://www.snapeda.com/parts/5015/Keystone/view-part/?ref=eda
U12 = TPS259530DSGR: 2.7-V to 18-V, 34m&Omega;, 0.5-4A eFuse with over voltage protection in small WSON package 8-WSON -40 to 125; Manufacturer_Name: Texas Instruments; TYPE: TYPE; RefDes: RefDes; Copyright: Copyright (C) 2025 Ultra Librarian. All rights reserved.; Manufacturer_Part_Number: TPS259530DSGR

## Sheet Safety_Control.SchDoc
size 431 x 279 mm; SheetNumber: 4; SheetTotal: 5
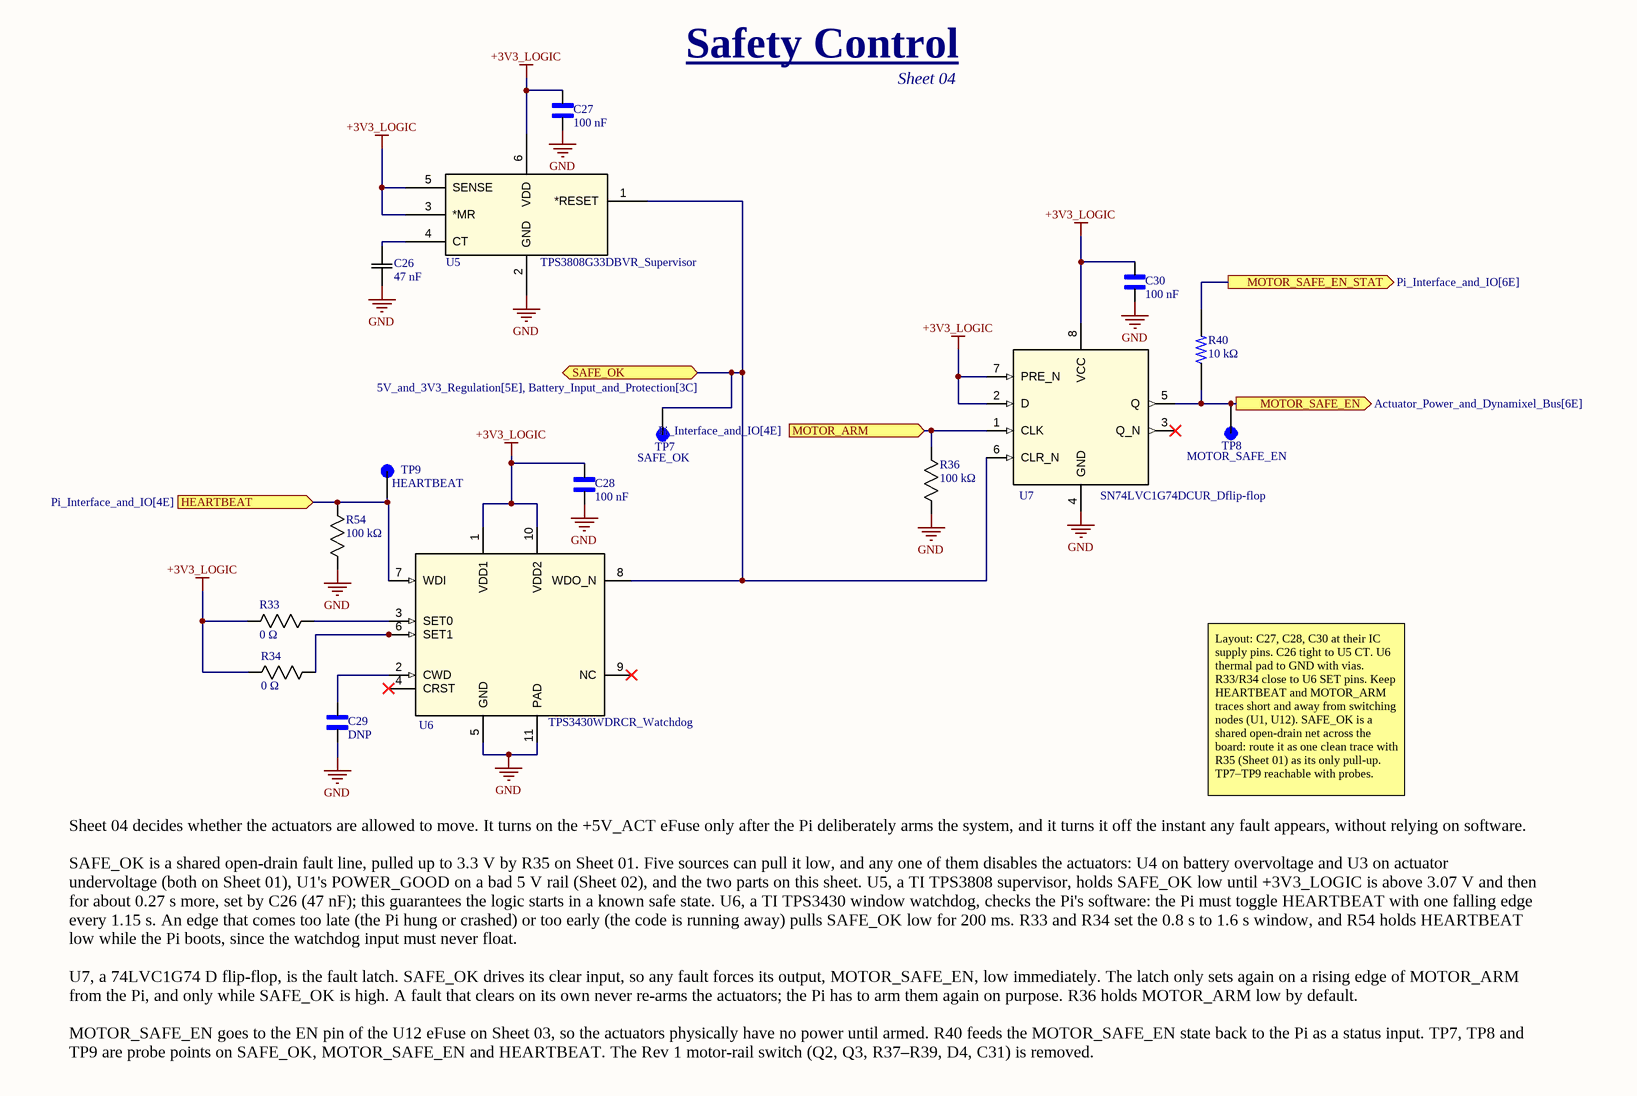
[diagram p3: Safety_Control.SchDoc]

### Parts
C26  47 nF  [YAG_CC0603_YAG]
C27  100 nF  [CAPC1608X90N]
C28  100 nF  [CAPC1608X90N]
C29  DNP  [CAPC1608X90N]
C30  100 nF  [CAPC1608X90N]
R33  0 Ω  [RC0603N_YAG]
R34  0 Ω  [RC0603N_YAG]
R36  100 kΩ  [RC0603N_YAG]
R40  10 kΩ  [RESC1607X60N]
R54  100 kΩ  [RC0603N_YAG]
TP7  SAFE_OK  [KEYSTONE_5015]
TP8  MOTOR_SAFE_EN  [KEYSTONE_5015]
TP9  HEARTBEAT  [KEYSTONE_5015]
U5  TPS3808G33DBVR_Supervisor  [DBV6]
U6  TPS3430WDRCR_Watchdog  [DRC0010J]
U7  SN74LVC1G74DCUR_Dflip-flop  [DCU0008A_N]

### Ports
HEARTBEAT (in, see Pi_Interface_and_IO[4E]), MOTOR_ARM (in, see Pi_Interface_and_IO[4E]), MOTOR_SAFE_EN (out, see Actuator_Power_and_Dynamixel_Bus[6E]), MOTOR_SAFE_EN_STAT (out, see Pi_Interface_and_IO[6E]), SAFE_OK (bidir, see 5V_and_3V3_Regulation[5E], Battery_Input_and_Protection[3C])

### Nets
+3V3_LOGIC: C27.2 C28.2 C30.2 R33.2 R34.2 U5.3(*MR) U5.5(SENSE) U5.6(VDD) U6.1(VDD1) U6.10(VDD2) U7.2(D) U7.7(PRE_N) U7.8(VCC)
GND: C26.1 C27.1 C28.1 C29.1 C30.1 R36.2 R54.1 U5.2(GND) U6.5(GND) U6.11(PAD) U7.4(GND)
HEARTBEAT: R54.2 TP9.TP U6.7(WDI) ; port HEARTBEAT
MOTOR_ARM: R36.1 U7.1(CLK) ; port MOTOR_ARM
MOTOR_SAFE_EN: R40.1 TP8.TP U7.5(Q) ; port MOTOR_SAFE_EN
MOTOR_SAFE_EN_STAT: R40.2 ; port MOTOR_SAFE_EN_STAT
SAFE_OK: TP7.TP U5.1(*RESET) U6.8(WDO_N) U7.6(CLR_N) ; port SAFE_OK
NetC26_2: C26.2 U5.4(CT)
NetC29_2: C29.2 U6.2(CWD)
NetR33_1: R33.1 U6.3(SET0)
NetR34_1: R34.1 U6.6(SET1)

Not connected (* = marked no-connect by the designer): U6 4(CRST)* 9(NC)*; U7 3(Q_N)*

### Notes on the sheet
- Safety Control
- Sheet 04
- Layout: C27, C28, C30 at their IC supply pins. C26 tight to U5 CT. U6 thermal pad to GND with vias. R33/R34 close to U6 SET pins. Keep HEARTBEAT and MOTOR_ARM traces short and away from switching nodes (U1, U12). SAFE_OK is a shared open-drain net across the board: route it as one clean trace with R35 (Sheet 01) as its only pull-up. TP7–TP9 reachable with probes.
- Sheet 04 decides whether the actuators are allowed to move. It turns on the +5V_ACT eFuse only after the Pi deliberately arms the system, and it turns it off the instant any fault appears, without relying on software.
  SAFE_OK is a shared open-drain fault line, pulled up to 3.3 V by R35 on Sheet 01. Five sources can pull it low, and any one of them disables the actuators: U4 on battery overvoltage and U3 on actuator undervoltage (both on Sheet 01), U1's POWER_GOOD on a bad 5 V rail (Sheet 02), and the two parts on this sheet. U5, a TI TPS3808 supervisor, holds SAFE_OK low until +3V3_LOGIC is above 3.07 V and then for about 0.27 s more, set by C26 (47 nF); this guarantees the logic starts in a known safe state. U6, a TI TPS3430 window watchdog, checks the Pi's software: the Pi must toggle HEARTBEAT with one falling edge every 1.15 s. An edge that comes too late (the Pi hung or crashed) or too early (the code is running away) pulls SAFE_OK low for 200 ms. R33 and R34 set the 0.8 s to 1.6 s window, and R54 holds HEARTBEAT low while the Pi boots, since the watchdog input must never float.
  U7, a 74LVC1G74 D flip-flop, is the fault latch. SAFE_OK drives its clear input, so any fault forces its output, MOTOR_SAFE_EN, low immediately. The latch only sets again on a rising edge of MOTOR_ARM from the Pi, and only while SAFE_OK is high. A fault that clears on its own never re-arms the actuators; the Pi has to arm them again on purpose. R36 holds MOTOR_ARM low by default.
  MOTOR_SAFE_EN goes to the EN pin of the U12 eFuse on Sheet 03, so the actuators physically have no power until armed. R40 feeds the MOTOR_SAFE_EN state back to the Pi as a status input. TP7, TP8 and TP9 are probe points on SAFE_OK, MOTOR_SAFE_EN and HEARTBEAT. The Rev 1 motor-rail switch (Q2, Q3, R37–R39, D4, C31) is removed.
- DWG. NO.
- REV.
- SHT.
- THIS DOCUMENT AND THE DATA DISCLOSED HEREIN OR HEREWITH IS THE PROPERTY OF ALTIUM LIMITED AND MAY BE FREELY DISTRIBUTED IN WHOLE. NO RIGHTS ARE RESERVED OR EXPRESS OR IMPLIED WARANTEE GIVEN.
- REVISION
- DESCRIPTION
- DATE
- APPROVED
- ENG:
- APPROVALS
- PROJECT
- DSN:
- CHK:
- REFERENCE DOCUMENTS
- PROJECT REVISION:
- TITLE
- DOCUMENT REVISION:
- DESIGN ITEM:
- BOM:
- FAB DWG:
- PCB DWG:
- ASSY DWG:
- SCALE:
- SIZE
- B
- CAGE CODE
- FILE NAME
- DWG NO.
- SHEET
- OF
- REV

### Library data of the parts
C26 = CC0603KRX7R9BB473: Yageo CC0603KRX7R9BB473 / 47 nF 50 V X7R / 0603 / U5 CT delay: 47 nF / 175 nF + 0.5 ms ≈ 0.27 s / https://www.digikey.com/en/products/result?keywords=CC0603KRX7R9BB473; Copyright: Copyright (C) 2026 Ultra Librarian. All rights reserved.; Manufacturer_Name: Yageo; Manufacturer_Part_Number: CC0603KRX7R9BB473
C27 = GRM188R71H104KA93D: SMD Capacitor X7R(EIA) with Capacitance: 0.10uF Tol. 10%. Rated Voltage: 50Vdc / Murata GRM188R71H104KA93D / 100 nF 50 V X7R / 0603 / U5 supply / https://www.digikey.com/en/products/result?keywords=GRM188R71H104KA93D; SnapEDA_Link: https://www.snapeda.com/parts/GRM188R71H104KA93D/Murata/view-part/?ref=snap; Package: 1608 Murata; Value: *; MF: Murata; MP: GRM188R71H104KA93D; Check_prices: https://www.snapeda.com/parts/GRM188R71H104KA93D/Murata/view-part/?ref=eda
C28 C29 = GRM188R71H104KA93D: SMD Capacitor X7R(EIA) with Capacitance: 0.10uF Tol. 10%. Rated Voltage: 50VdcMurata GRM188R71H104KA93D / 100 nF 50 V X7R / 0603 / U6 supply / https://www.digikey.com/en/products/result?keywords=GRM188R71H104KA93D; MF: Murata; SnapEDA_Link: https://www.snapeda.com/parts/GRM188R71H104KA93D/Murata/view-part/?ref=snap; Package: 1608 Murata; Value: *; MP: GRM188R71H104KA93D; Check_prices: https://www.snapeda.com/parts/GRM188R71H104KA93D/Murata/view-part/?ref=eda
C30 = GRM188R71H104KA93D: SMD Capacitor X7R(EIA) with Capacitance: 0.10uF Tol. 10%. Rated Voltage: 50Vdc / Murata GRM188R71H104KA93D / 100 nF 50 V X7R / 0603 / U7 supply / https://www.digikey.com/en/products/result?keywords=GRM188R71H104KA93D; SnapEDA_Link: https://www.snapeda.com/parts/GRM188R71H104KA93D/Murata/view-part/?ref=snap; Package: 1608 Murata; Value: *; MF: Murata; MP: GRM188R71H104KA93D; Check_prices: https://www.snapeda.com/parts/GRM188R71H104KA93D/Murata/view-part/?ref=eda
R33 R34 = RC0603JR-070RL: RES SMD 0 OHM 1% JUMPER 1/10W 0603 / 0 Ω / https://www.digikey.com/en/products/category/resistors/2?s=N4IgTCBcDaIEoGEAMA2JBmAUnAtEg7EnADIgC6AvkA; Manufacturer_Name: Yageo; Copyright: Copyright (C) 2025 Ultra Librarian. All rights reserved.; Manufacturer_Part_Number: RC0603JR-070RL
R36 = RC0603FR-07100KL: RES, 100 k, 1%, 0.1 W, 0603 / Yageo RC0603FR-07100KL / 100 kΩ 1 % / 0603 / MOTOR_ARM pulldown / https://www.digikey.com/en/products/result?keywords=RC0603FR-07100KL; Copyright: Copyright (C) 2025 Ultra Librarian. All rights reserved.; Manufacturer_Name: Yageo; Manufacturer_Part_Number: RC0603FR-07100KL
R40 = RC0603FR-0710KL: 10 kOhms Â±1% 0.1W, 1/10W Chip Resistor 0603 (1608 Metric) Moisture Resistant Thick Film / Yageo RC0603FR-0710KL / 10 kΩ 1 % / 0603 / Series to Pi on MOTOR_SAFE_EN status / https://www.digikey.com/en/products/result?keywords=RC0603FR-0710KL; SnapEDA_Link: https://www.snapeda.com/parts/RC0603FR-0710KL/Yageo/view-part/?ref=snap; Package: 0603 Yageo; Value: *; MF: Yageo; MP: RC0603FR-0710KL; Check_prices: https://www.snapeda.com/parts/RC0603FR-0710KL/Yageo/view-part/?ref=eda
R54 = RC0603FR-07100KL: RES, 100 k, 1%, 0.1 W, 0603 / Yageo RC0603FR-07100KL / 100 kΩ 1 % / 0603 / HEARTBEAT pulldown: TI says WDI must never float, and the Pi pin is Hi-Z while it boots / https://www.digikey.com/en/products/result?keywords=RC0603FR-07100KL; Copyright: Copyright (C) 2025 Ultra Librarian. All rights reserved.; Manufacturer_Name: Yageo; Manufacturer_Part_Number: RC0603FR-07100KL
TP7-TP9 = 5015: as TP4 on sheet 5V_and_3V3_Regulation; SnapEDA_Link: https://www.snapeda.com/parts/5015/Keystone/view-part/?ref=snap; Package: None; Value: *; MF: Keystone Electronics; MP: 5015; Check_prices: https://www.snapeda.com/parts/5015/Keystone/view-part/?ref=eda
U5 = TPS3808G33DBVR: Low-quiescent current supervisor with programmable delay & manual reset 6-SOT-23 -40 to 125; Manufacturer_Name: Texas Instruments; Copyright: Copyright (C) 2025 Ultra Librarian. All rights reserved.; Manufacturer_Part_Number: TPS3808G33DBVR; RefDes: RefDes; Type: Type
U6 = TPS3430WDRCR: Window watchdog timer with programmable reset delay 10-VSON -40 to 125; Manufacturer_Name: Texas Instruments; TYPE: TYPE; RefDes: RefDes; Copyright: Copyright (C) 2026 Ultra Librarian. All rights reserved.; Manufacturer_Part_Number: TPS3430WDRCR
U7 = SN74LVC1G74DCUR: Single Positive-Edge-Triggered D-Type Flip-Flop With Clear and Preset 8-VSSOP -40 to 125; Manufacturer_Name: Texas Instruments; Alternate_PartNumber: SN74LVC1G74DCUT; CompType: IC; TYPE: TYPE; RefDes: RefDes; Copyright: Copyright (C) 2026 Ultra Librarian. All rights reserved.; Manufacturer_Part_Number: SN74LVC1G74DCUR; Application_BuildNumber: *; PartNumber: SN74LVC1G74DCUR; PackageReference: DCU0008A; MountType: SMT; RoHS: Y; Manufacturer: Texas Instruments